# Altium schematic sheet LED_Driver.SchDoc
size A4
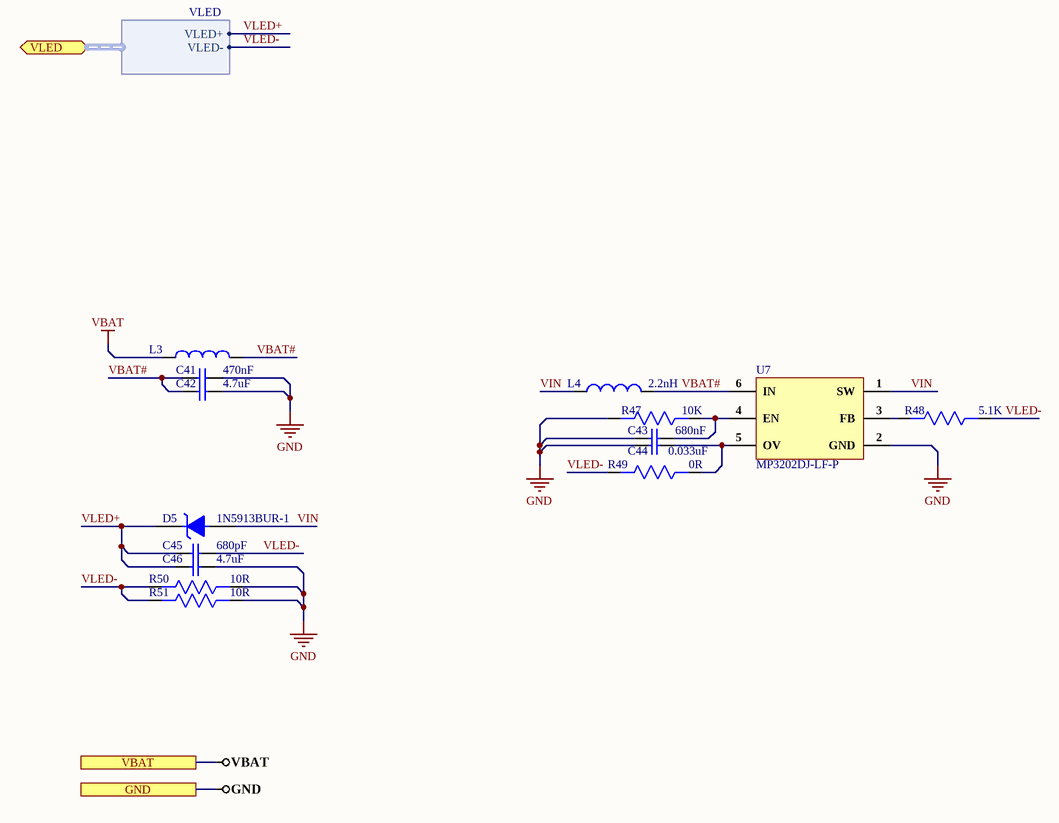
[diagram p0: LED_Driver.SchDoc]

## Parts
C41  470nF  [CAP 0201]
C42  4.7uF  [Cap0603]
C43  680nF  [Cap0603]
C44  0.033uF  [Cap0402]
C45  680pF  [CAP 0201]
C46  4.7uF  [Cap0603]
D5  1N5913BUR-1  [DO-213AB]
L3  BLM18AG121SN1D  [Ind 0603]  (value not drawn)
L4  2.2nH  [IND 0402]
R47  10K  [Res-0201]
R48  5.1K  [Res-0201]
R49  0R  [Res-0201]
R50  10R  [Res-0201]
R51  10R  [Res-0201]
U7  MP3202DJ-LF-P  [SOT-23-6]

## Ports
GND, VBAT, VLED (bidir, harness VLED)

## Harnesses
VLED: VLED+, VLED-

## Nets
GND: C41.2 C42.2 C43.1 C44.1 C46.2 R47.2 R50.1 R51.1 U7.2(GND) ; port GND
VBAT: L3.1 ; port VBAT
VBAT#: C41.1 C42.1 L3.2 L4.2 U7.6(IN)
VIN: D5.2(ANODE) L4.1 U7.1(SW)
VLED+: C45.1 C46.1 D5.1(CATHODE) ; port VLED.VLED+
VLED-: C45.2 R48.1 R49.2 R50.2 R51.2 ; port VLED.VLED-
NetC43_2: C43.2 R47.1 U7.4(EN)
NetC44_2: C44.2 R49.1 U7.5(OV)
NetR48_2: R48.2 U7.3(FB)

## Library data of the parts
C41 = EMK063BBJ474MPLF: CAP CER 0.47UF 16V X5R 0201; Manufacturer: Taiyo Yuden; Supplier 1: Digi-Key; Manufacturer Part Number: EMK063BBJ474MPLF; RoHS: Yes; Category: Ceramic Capacitors; Stock 1: 77979; Pricing 1: 1=0.30000, 10=0.20500, 50=0.13680, 100=0.11630, 500=0.08210, 1000=0.07184, 2500=0.06842, 5000=0.06329 (USD); RoHS Compliant: Yes; Supplier Part Number 1: 587-6265-1-ND
C42 C46 = C1608X5R1E475M080AC: CAP CER 4.7UF 25V X5R 0603; Manufacturer: TDK; Dielectric Material: Ceramic; Tolerance: 20%; ComponentLink1URL: http://www.yageo.com/NewPortal/_en/search/productDocs.jsp?YageoPartNumber=AC0603JRNPO0BN470&src-supplier=Digi-Key; ComponentLink1Description: http://www.yageo.com/NewPortal/_en/search/productDocs.jsp?YageoPartNumber=AC0603JRNPO0BN470&src-supplier=Digi-Key; Supplier 1: Mouser; Manufacturer Part Number: C1608X5R1E475M080AC; Stock 1: 40236; Pricing 1: 1=0.29, 10=0.237, 100=0.142, 500=0.106, 1000=0.09, 4000=0.076, 8000=0.072, 24000=0.07, 48000=0.067 (USD); Mount: Surface Mount; Case/Package: 0603; Weight: 7.1E-05oz; Case Code (Metric): 1608; Case Code (Imperial): 0603; Min Operating Temperature: -55°C; Max Operating Temperature: 85°C; Voltage Rating (DC): 25V; Packaging: Tape and Reel; Package Quantity: 1; Capacitance: 4.7uF; Voltage Rating: 25V; Dielectric: X5R; Termination: SMD/SMT; Composition: Ceramic; Length: 1.6mm; Height: 0.8mm; Width: 0.031inch; Thickness: 0.039inch; Depth: 0.8mm; Radiation Hardening: No; REACH SVHC: No SVHC; Lead Free: Lead Free; ComponentLink2URL: https://www.verical.com/server-webapp/html/getDatasheet?partID=726745&src-supplier=Verical; ComponentLink2Description: https://www.verical.com/server-webapp/html/getDatasheet?partID=726745&src-supplier=Verical; Supplier Part Number 1: 810-C1608X5R1E475M
C43 = CC0603ZRY5V7BB684: CAP CER 0.68UF 16V Y5V 0603; Manufacturer: Yageo; Tolerance: 80%; Supplier 1: Digi-Key; Manufacturer Part Number: CC0603ZRY5V7BB684; RoHS: Yes; Category: Ceramic Capacitors; Stock 1: 604; Pricing 1: 1=0.12000, 10=0.08200, 50=0.04660, 100=0.03860, 500=0.02704, 1000=0.02239 (USD); Mount: Surface Mount; Case/Package: 0603; Case Code (Metric): 1608; Case Code (Imperial): 0603; Min Operating Temperature: -30°C; Max Operating Temperature: 85°C; Voltage Rating: 16V; Voltage Rating (DC): 16V; Capacitance: 680nF; Packaging: Tape and Reel; Length: 0.063inch; Width: 0.031inch; Thickness: 0.035inch; Lead Free: Lead Free; Halogen Free: Halogen Free; ComponentLink1URL: http://www.mouser.com/ds/2/447/Yageo_UPY-GP_NP0_16V-to-50V_9-358835.pdf?src-supplier=Mouser; ComponentLink1Description: http://www.mouser.com/ds/2/447/Yageo_UPY-GP_NP0_16V-to-50V_9-358835.pdf?src-supplier=Mouser; ComponentLink2URL: http://www.yageo.com/documents/recent/UPY-GPHC_Y5V_6.3V-to-50V_8.pdf?src-supplier=Digi-Key; ComponentLink2Description: http://www.yageo.com/documents/recent/UPY-GPHC_Y5V_6.3V-to-50V_8.pdf?src-supplier=Digi-Key; Supplier Part Number 1: 311-1828-1-ND
C44 = 0402YD333KAT2A: CAP CER 0.033UF 16V X5R 0402; Manufacturer: Kyocera AVX; Capacitance: 33nF; Tolerance: 10%; Supplier 1: Digi-Key; Manufacturer Part Number: 0402YD333KAT2A; RoHS: Yes; Category: Ceramic Capacitors; Stock 1: 19862; Pricing 1: 1=0.14000, 10=0.10200, 50=0.05780, 100=0.04780, 500=0.03356, 1000=0.02778, 2500=0.02585, 5000=0.02365 (USD); Mount: Surface Mount; Case/Package: 0402; Number of Pins: 2; Case Code (Metric): 1005; Case Code (Imperial): 0402; Weight: 2.3E-05oz; Min Operating Temperature: -55°C; Max Operating Temperature: 85°C; Packaging: Tape and Reel; Voltage Rating (DC): 16V; Dielectric: X5R; Voltage Rating: 16V; Package Quantity: 10000; Termination: SMD/SMT; Series: 0402; Construction: Flat; Length: 1mm; Width: 0.02inch; Height: 0.56mm; Thickness: 0.022inch; Depth: 0.5mm; Radiation Hardening: No; REACH SVHC: No SVHC; Lead Free: Lead Free; RoHS Compliant: Yes; ComponentLink1URL: https://datasheet.ciiva.com/22619/1666675-22619797.pdf?src-supplier=Element14; ComponentLink1Description: https://datasheet.ciiva.com/22619/1666675-22619797.pdf?src-supplier=Element14; ComponentLink2URL: https://datasheet.ciiva.com/150/cx5r-150518.pdf?src-supplier=Digi-Key; ComponentLink2Description: https://datasheet.ciiva.com/150/cx5r-150518.pdf?src-supplier=Digi-Key; ComponentLink3URL: https://datasheet.ciiva.com/150/cx5r-150519.pdf?src-supplier=Digi-Key; ComponentLink3Description: https://datasheet.ciiva.com/150/cx5r-150519.pdf?src-supplier=Digi-Key; ComponentLink4URL: https://datasheet.ciiva.com/150/cx5r-150520.pdf?src-supplier=Digi-Key; ComponentLink4Description: https://datasheet.ciiva.com/150/cx5r-150520.pdf?src-supplier=Digi-Key; ComponentLink5URL: https://datasheet.ciiva.com/28454/1666675-28454250.pdf?src-supplier=Element14; ComponentLink5Description: https://datasheet.ciiva.com/28454/1666675-28454250.pdf?src-supplier=Element14; ComponentLink6URL: https://datasheet.ciiva.com/5421/cx5r-5421803.pdf?src-supplier=Mouser; ComponentLink6Description: https://datasheet.ciiva.com/5421/cx5r-5421803.pdf?src-supplier=Mouser; ComponentLink7URL: https://datasheet.ciiva.com/15212/getdatasheetpartid-310214-15212123.pdf?src-supplier=Verical; ComponentLink7Description: https://datasheet.ciiva.com/15212/getdatasheetpartid-310214-15212123.pdf?src-supplier=Verical; Supplier Part Number 1: 478-1123-1-ND
C45 = GRM033R71H681MA12D: CAP CER 680PF 50V X7R 0201; Manufacturer: Murata; Tolerance: 20%; Supplier 1: Digi-Key; Manufacturer Part Number: GRM033R71H681MA12D; RoHS: Yes; Category: Ceramic Capacitors; Stock 1: 2794; Pricing 1: 1=0.10000, 10=0.02500, 50=0.01380, 100=0.01130, 500=0.00808, 1000=0.00635, 2500=0.00578, 5000=0.00531 (USD); Mount: Surface Mount; Case/Package: 0201; Case Code (Imperial): 0201; Case Code (Metric): 0603; Weight: 1.2E-05oz; Min Operating Temperature: -55°C; Max Operating Temperature: 125°C; Capacitance: 680pF; Packaging: Tape and Reel; Voltage Rating: 50V; Dielectric: X7R; Termination: SMD/SMT; Resistor Type: Ceramic; Voltage Rating (DC): 50V; Package Quantity: 15000; Length: 0.024inch; Width: 0.3mm; Height: 0.3mm; Thickness: 0.013inch; RoHS Compliant: Yes; ComponentLink1URL: http://www.mouser.com/ds/2/281/c02e-2905.pdf?src-supplier=Mouser; ComponentLink1Description: http://www.mouser.com/ds/2/281/c02e-2905.pdf?src-supplier=Mouser; ComponentLink2URL: http://search.murata.co.jp/Ceramy/image/img/A01X/G101/ENG/GRM033R71H681MA12-01.pdf?src-supplier=Digi-Key; ComponentLink2Description: http://search.murata.co.jp/Ceramy/image/img/A01X/G101/ENG/GRM033R71H681MA12-01.pdf?src-supplier=Digi-Key; ComponentLink3URL: https://search.murata.co.jp/Ceramy/image/img/A01X/G101/ENG/GRM033R71H681MA12-01.pdf?src-supplier=Digi-Key; ComponentLink3Description: https://search.murata.co.jp/Ceramy/image/img/A01X/G101/ENG/GRM033R71H681MA12-01.pdf?src-supplier=Digi-Key; Supplier Part Number 1: 490-16749-1-ND
D5 = 1N5913BUR-1: DIODE ZENER 3.3V 1.25W DO213AB; Manufacturer: Microsemi; Tolerance: 5%; Impedance: 10R; Max Reverse Leakage Current: 100uA; Element Configuration: Single; Supplier 1: Mouser; Manufacturer Part Number: 1N5913BUR-1; RoHS: No; Category: Zener Diodes; Stock 1: 85; Pricing 1: 1=3.01000, 10=3.01000, 50=3.01000, 100=2.80000, 1000=2.80000, 10000=2.80000 (USD); Mount: Surface Mount; Case/Package: DO-213AB; Number of Pins: 2; Min Operating Temperature: -65°C; Max Operating Temperature: 175°C; Packaging: Bulk; Max Power Dissipation: 1.25W; Zener Voltage: 3.3V; Series: -; Radiation Hardening: Yes; RoHS Compliant: No; ComponentLink1URL: https://datasheet.ciiva.com/29596/lds-0300-1-29596489.pdf?src-supplier=Digi-Key; ComponentLink1Description: https://datasheet.ciiva.com/29596/lds-0300-1-29596489.pdf?src-supplier=Digi-Key; Supplier Part Number 1: 494-1N5913BUR-1
L3 = BLM18AG121SN1D: FERRITE BEAD 120 OHM 0603 1LN; Manufacturer: Murata; Material: Steel,Ferrite; Impedance: 120R; Tolerance: 25%; Max DC Current: 500mA; DC Resistance (DCR): 180mR; Test Frequency: 100MHz; Number of Lines: 1; Shielding: Unshielded; Supplier 1: Digi-Key; Manufacturer Part Number: BLM18AG121SN1D; RoHS: Yes; Category: Inductors; Stock 1: 260809; Pricing 1: 1=0.10000, 10=0.07200, 25=0.06560, 50=0.05900, 100=0.04320, 250=0.03144, 500=0.02882, 1000=0.02489 (USD); Case/Package: 0603; Number of Pins: 2; Core Material: Ferrite; Case Code (Metric): 1608; Case Code (Imperial): 0603; Min Operating Temperature: -55°C; Max Operating Temperature: 125°C; Package Quantity: 1; Max Current Rating: 500mA; Packaging: Tape and Reel; Current Rating: 500mA; Termination: SMD/SMT; DC Current: 500mA; Frequency: 100MHz; Number of Circuits: 1; Series: BLM18A; DC Resistance-Max: 180mR; Length: 1.6mm; Width: 0.8mm; Height: 0.8mm; Depth: 0.8mm; Radiation Hardening: No; REACH SVHC: No SVHC; Military Standard: Not; Lead Free: Lead Free; RoHS Compliant: Yes; ComponentLink1URL: https://datasheet.ciiva.com/11795/0900766b811b5866-11795382.pdf?src-supplier=RSComponents; ComponentLink1Description: https://datasheet.ciiva.com/11795/0900766b811b5866-11795382.pdf?src-supplier=RSComponents; ComponentLink2URL: https://datasheet.ciiva.com/19460/1844723-19460204.pdf?src-supplier=Jameco; ComponentLink2Description: https://datasheet.ciiva.com/19460/1844723-19460204.pdf?src-supplier=Jameco; ComponentLink3URL: https://datasheet.ciiva.com/29347/442268-da-01-en-chip-drossel-0603-120r-500ma-1-6x0-8mm-29347890.pdf?src-supplier=Conrad; ComponentLink3Description: https://datasheet.ciiva.com/29347/442268-da-01-en-chip-drossel-0603-120r-500ma-1-6x0-8mm-29347890.pdf?src-supplier=Conrad; ComponentLink4URL: https://datasheet.ciiva.com/41449/001172222-da-01-en-drossel-0603-120r-1-6x0-8mm-4000st-41449509.pdf?src-supplier=Conrad; ComponentLink4Description: https://datasheet.ciiva.com/41449/001172222-da-01-en-drossel-0603-120r-1-6x0-8mm-4000st-41449509.pdf?src-supplier=Conrad; ComponentLink5URL: https://datasheet.ciiva.com/14122/blm-series-eng-tds-14122902.pdf?src-supplier=Distrelec; ComponentLink5Description: https://datasheet.ciiva.com/14122/blm-series-eng-tds-14122902.pdf?src-supplier=Distrelec; ComponentLink6URL: https://datasheet.ciiva.com/17246/l0110s0100blm18a-17246919.pdf?src-supplier=Avnet+Europe; ComponentLink6Description: https://datasheet.ciiva.com/17246/l0110s0100blm18a-17246919.pdf?src-supplier=Avnet+Europe; ComponentLink7URL: https://datasheet.ciiva.com/3081/l0110s0100blm18a-3081610.pdf?src-supplier=Avnet; ComponentLink7Description: https://datasheet.ciiva.com/3081/l0110s0100blm18a-3081610.pdf?src-supplier=Avnet; ComponentLink8URL: https://datasheet.ciiva.com/1012/l0110s0100blm18a-1012011.pdf?src-supplier=Digi-Key; ComponentLink8Description: https://datasheet.ciiva.com/1012/l0110s0100blm18a-1012011.pdf?src-supplier=Digi-Key; ComponentLink9URL: https://datasheet.ciiva.com/1012/l0110s0100blm18a-1012012.pdf?src-supplier=Digi-Key; ComponentLink9Description: https://datasheet.ciiva.com/1012/l0110s0100blm18a-1012012.pdf?src-supplier=Digi-Key; ComponentLink10URL: https://datasheet.ciiva.com/8510/l0110s0100blm18a-8510156.pdf?src-supplier=Avnet; ComponentLink10Description: https://datasheet.ciiva.com/8510/l0110s0100blm18a-8510156.pdf?src-supplier=Avnet; ComponentLink11URL: https://datasheet.ciiva.com/1012/l0110s0100blm18a-1012013.pdf?src-supplier=Digi-Key; ComponentLink11Description: https://datasheet.ciiva.com/1012/l0110s0100blm18a-1012013.pdf?src-supplier=Digi-Key; ComponentLink12URL: https://datasheet.ciiva.com/16215/l0110s0100blm18a-16215230.pdf?src-supplier=Future+Electronics; ComponentLink12Description: https://datasheet.ciiva.com/16215/l0110s0100blm18a-16215230.pdf?src-supplier=Future+Electronics; Supplier Part Number 1: 490-1011-1-ND
L4 = BSCH001005052N2SCP: FIXED IND 2.2NH 400MA 120 MOHM; Manufacturer: Chilisin; Supplier 1: Digi-Key; Manufacturer Part Number: BSCH001005052N2SCP; RoHS: Yes; Stock 1: 6911; Pricing 1: 1=0.10000, 10=0.01800, 25=0.01600, 50=0.01420, 100=0.01210, 250=0.01072, 500=0.00982, 1000=0.00839, 2500=0.00750 (USD); Supplier Part Number 1: 2184-BSCH001005052N2SCPCT-ND
R47 = RC0201FR-0710KL: RES SMD 10K OHM 1% 1/20W 0201; Manufacturer: Yageo; Resistance: 10kR; Temperature Coefficient: 200ppm/°C; Power Rating: 50mW; Voltage Rating: 25V; Supplier 1: Digi-Key; Manufacturer Part Number: RC0201FR-0710KL; Stock 1: 12729696; Pricing 1: 1=0.1, 10=0.042, 100=0.0171, 1000=0.00768, 2500=0.00666, 5000=0.00551 (USD); Case/Package: 0201; Number of Pins: 2; Weight: 6E-06oz; Contact Plating: Tin,Matte; Case Code (Imperial): 0201; Case Code (Metric): 0603; Min Operating Temperature: -55°C; Max Operating Temperature: 125°C; Tolerance: 1%; Composition: Thick Film; Packaging: Tape and Reel; Package Quantity: 1; Termination: SMD/SMT; Number of Terminations: 2; Military Standard: Not; Max Power Dissipation: 50mW; Voltage Rating (DC): 25V; Working Voltage: 25V; Features: Moisture Resistant; Length: 0.6mm; Height: 0.01inch; Width: 0.3mm; Depth: 0.3mm; Radiation Hardening: No; REACH SVHC: No SVHC; Lead Free: Lead Free; ComponentLink1URL: http://www.yageo.com/documents/recent/PYu-RC_Group_51_RoHS_L_10.pdf?src-supplier=Digi-Key; ComponentLink1Description: http://www.yageo.com/documents/recent/PYu-RC_Group_51_RoHS_L_10.pdf?src-supplier=Digi-Key; ComponentLink2URL: http://www.farnell.com/datasheets/2167052.pdf?src-supplier=Element14; ComponentLink2Description: http://www.farnell.com/datasheets/2167052.pdf?src-supplier=Element14; ComponentLink3URL: http://www.yageo.com/documents/recent/PYu-RC0201_51_RoHS_L_8.pdf?src-supplier=Avnet; ComponentLink3Description: http://www.yageo.com/documents/recent/PYu-RC0201_51_RoHS_L_8.pdf?src-supplier=Avnet; ComponentLink4URL: http://www.yageo.com/documents/recent/PYu-RC0201_51_RoHS_L_8.pdf?src-supplier=Avnet+Europe; ComponentLink4Description: http://www.yageo.com/documents/recent/PYu-RC0201_51_RoHS_L_8.pdf?src-supplier=Avnet+Europe; ComponentLink5URL: https://www.verical.com/server-webapp/html/getDatasheet?partID=421074&src-supplier=Verical; ComponentLink5Description: https://www.verical.com/server-webapp/html/getDatasheet?partID=421074&src-supplier=Verical; ComponentLink6URL: http://www.farnell.com/datasheets/1421516.pdf?src-supplier=Element14; ComponentLink6Description: http://www.farnell.com/datasheets/1421516.pdf?src-supplier=Element14; Supplier Part Number 1: 311-10.0KMCT-ND
R48 = RC0201JR-075K1L: RES SMD 5.1K OHM 5% 1/20W 0201; Manufacturer: Yageo; Power Rating: 50mW; Resistance: 5.1kR; Voltage Rating: 25V; Temperature Coefficient: 200ppm/°C; Supplier 1: Digi-Key; Manufacturer Part Number: RC0201JR-075K1L; RoHS: Yes; Category: Chip SMD Resistors; Stock 1: 39719; Pricing 1: 1=0.10000, 10=0.02800, 100=0.01140, 1000=0.00513, 2500=0.00445, 5000=0.00368 (USD); Case/Package: 0201; Case Code (Imperial): 0201; Case Code (Metric): 0603; Size Code: 0201; Min Operating Temperature: -55°C; Max Operating Temperature: 125°C; Packaging: Tape and Reel; Tolerance: 5%; Resistor Type: Thick Film; Number of Terminations: 2; Termination: SMD/SMT; Max Power Dissipation: 50mW; Features: Moisture Resistant; Series: RC; Length: 0.024inch; Width: 0.012inch; Height: 0.01inch; Lead Free: Lead Free; RoHS Compliant: Yes; ComponentLink1URL: https://datasheet.ciiva.com/17419/rc0201jr-075k1l-17419401.pdf?src-supplier=Future+Electronics; ComponentLink1Description: https://datasheet.ciiva.com/17419/rc0201jr-075k1l-17419401.pdf?src-supplier=Future+Electronics; Supplier Part Number 1: YAG2910CT-ND
R49 = RC0201JR-070RL: RES SMD 0 OHM JUMPER 1/20W 0201
R50 R51 = RC0201JR-0710RL: RES SMD 10 OHM 5% 1/20W 0201; Manufacturer: Yageo; Temperature Coefficient: 350ppm/°C; Power Rating: 50mW; Voltage Rating: 25V; Supplier 1: Digi-Key; Manufacturer Part Number: RC0201JR-0710RL; RoHS: Yes; Category: Chip SMD Resistors; Stock 1: 546347; Pricing 1: 1=0.10000, 10=0.02800, 100=0.01140, 1000=0.00513, 2500=0.00445, 5000=0.00368 (USD); Case/Package: 0201; Number of Pins: 2; Contact Plating: Tin,Matte; Case Code (Metric): 0603; Case Code (Imperial): 0201; Size Code: 0201; Min Operating Temperature: -55°C; Max Operating Temperature: 125°C; Tolerance: 5%; Resistance: 10R; Resistor Type: Thick Film; Packaging: Tape and Reel; Package Quantity: 1; Number of Terminations: 2; Max Power Dissipation: 50mW; Voltage Rating (DC): 25V; Features: Moisture Resistant; Series: RC; Resistance Tolerance: 5%; Construction: Rectangular; Length: 0.024inch; Width: 0.012inch; Height: 0.01inch; Depth: 0.3mm; Radiation Hardening: No; REACH SVHC: No SVHC; Military Standard: Not; Lead Free: Lead Free; RoHS Compliant: Yes; ComponentLink1URL: https://datasheet.ciiva.com/16855/pyu-rc0201-51-rohs-l-8-16855765.pdf?src-supplier=Avnet+Europe; ComponentLink1Description: https://datasheet.ciiva.com/16855/pyu-rc0201-51-rohs-l-8-16855765.pdf?src-supplier=Avnet+Europe; ComponentLink2URL: https://datasheet.ciiva.com/5757/443682-5757899.pdf?src-supplier=Farnell; ComponentLink2Description: https://datasheet.ciiva.com/5757/443682-5757899.pdf?src-supplier=Farnell; ComponentLink3URL: https://datasheet.ciiva.com/2462/pyu-r-int-thick-7-2462844.pdf?src-supplier=Digi-Key; ComponentLink3Description: https://datasheet.ciiva.com/2462/pyu-r-int-thick-7-2462844.pdf?src-supplier=Digi-Key; ComponentLink4URL: https://datasheet.ciiva.com/2462/pyu-r-int-thick-7-2462845.pdf?src-supplier=Digi-Key; ComponentLink4Description: https://datasheet.ciiva.com/2462/pyu-r-int-thick-7-2462845.pdf?src-supplier=Digi-Key; ComponentLink5URL: https://datasheet.ciiva.com/2462/pyu-r-int-thick-7-2462846.pdf?src-supplier=Digi-Key; ComponentLink5Description: https://datasheet.ciiva.com/2462/pyu-r-int-thick-7-2462846.pdf?src-supplier=Digi-Key; ComponentLink6URL: https://datasheet.ciiva.com/7672/443682-7672255.pdf?src-supplier=Element14; ComponentLink6Description: https://datasheet.ciiva.com/7672/443682-7672255.pdf?src-supplier=Element14; Supplier Part Number 1: 311-10NCT-ND
U7 = MP3202DJ-LF-P: IC LED DRIVER; Manufacturer: Monolithic Power Systems; Number of Outputs: 1; Max Supply Voltage: 6V; Output Voltage: 25V; Output Current per Channel: 1.33A; Frequency: 1.3MHz; Topology: Boost; Dimming: Analog,PWM; Supplier 1: Digi-Key; Manufacturer Part Number: MP3202DJ-LF-P; RoHS: Yes; Category: LED Drivers; Stock 1: 1282; Pricing 1: 1=2.88000, 10=2.58400, 25=2.43800, 100=1.95040, 250=1.70660 (USD); Mount: Surface Mount; Case/Package: SOT-23-6; Min Operating Temperature: -40°C; Max Operating Temperature: 85°C; Packaging: Tape and Reel; Package Quantity: 500; Series: -; RoHS Compliant: Yes; ComponentLink1URL: http://www.mouser.com/ds/2/277/MP3202_r0.91-371710.pdf?src-supplier=Mouser; ComponentLink1Description: http://www.mouser.com/ds/2/277/MP3202_r0.91-371710.pdf?src-supplier=Mouser; ComponentLink2URL: http://www.monolithicpower.com/DesktopModules/DocumentManage/API/Document/GetDocument?id=1215&src-supplier=Digi-Key; ComponentLink2Description: http://www.monolithicpower.com/DesktopModules/DocumentManage/API/Document/GetDocument?id=1215&src-supplier=Digi-Key; ComponentLink3URL: https://www.monolithicpower.com/pub/media/document/MP3202_r0.91.pdf?src-supplier=Digi-Key; ComponentLink3Description: https://www.monolithicpower.com/pub/media/document/MP3202_r0.91.pdf?src-supplier=Digi-Key; ComponentLink4URL: http://www.monolithicpower.com/pub/media/document/MP3202_r0.91.pdf?src-supplier=Digi-Key; ComponentLink4Description: http://www.monolithicpower.com/pub/media/document/MP3202_r0.91.pdf?src-supplier=Digi-Key; Supplier Part Number 1: 1589-1151-1-ND